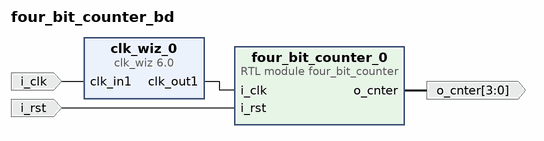
[diagram p0: block diagram of the top level]
# Vivado block design four_bit_counter_bd, xc7z020clg400-1, Vivado 2025.2.1
create_bd_design four_bit_counter_bd

create_bd_port -dir I -type rst i_rst
create_bd_port -dir I -type clk i_clk
create_bd_port -dir O -from 3 -to 0 o_cnter

create_bd_cell -type module -reference four_bit_counter four_bit_counter_0
create_bd_cell -type ip -vlnv xilinx.com:ip:clk_wiz:6.0 clk_wiz_0
set_property -dict [list \
  CONFIG.CLKOUT1_JITTER 181.828 \
  CONFIG.CLKOUT1_PHASE_ERROR 104.359 \
  CONFIG.CLKOUT1_REQUESTED_OUT_FREQ 25 \
  CONFIG.MMCM_CLKFBOUT_MULT_F 9.125 \
  CONFIG.MMCM_CLKOUT0_DIVIDE_F 36.500 \
  CONFIG.USE_LOCKED false \
  CONFIG.USE_RESET false \
] [get_bd_cells clk_wiz_0]

# ---- connections ----

connect_bd_net -net clk_in1_0_1 [get_bd_ports i_clk] [get_bd_pins clk_wiz_0/clk_in1]
connect_bd_net [get_bd_pins clk_wiz_0/clk_out1] [get_bd_pins four_bit_counter_0/i_clk]
connect_bd_net [get_bd_pins four_bit_counter_0/o_cnter] [get_bd_ports o_cnter]
connect_bd_net -net i_rst_0_1 [get_bd_ports i_rst] [get_bd_pins four_bit_counter_0/i_rst]

validate_bd_design
save_bd_design
